# Altium schematic sheet 02.C216. A01-A31,A32,A33,A34,A35,A36. Module BASU executive mechanisms.SchDoc: Кабель исполнительных механизмов
size 209 x 297 mm; Author: Мурашкин Д.В.; Address1: Address1; Address2: Address2; Address3: Address3; Address4: Address4; DocumentNumber: ИЗДЕЛИЕ-1-2; SheetNumber: 27; Scale: 1:1; Letter1Column: Э
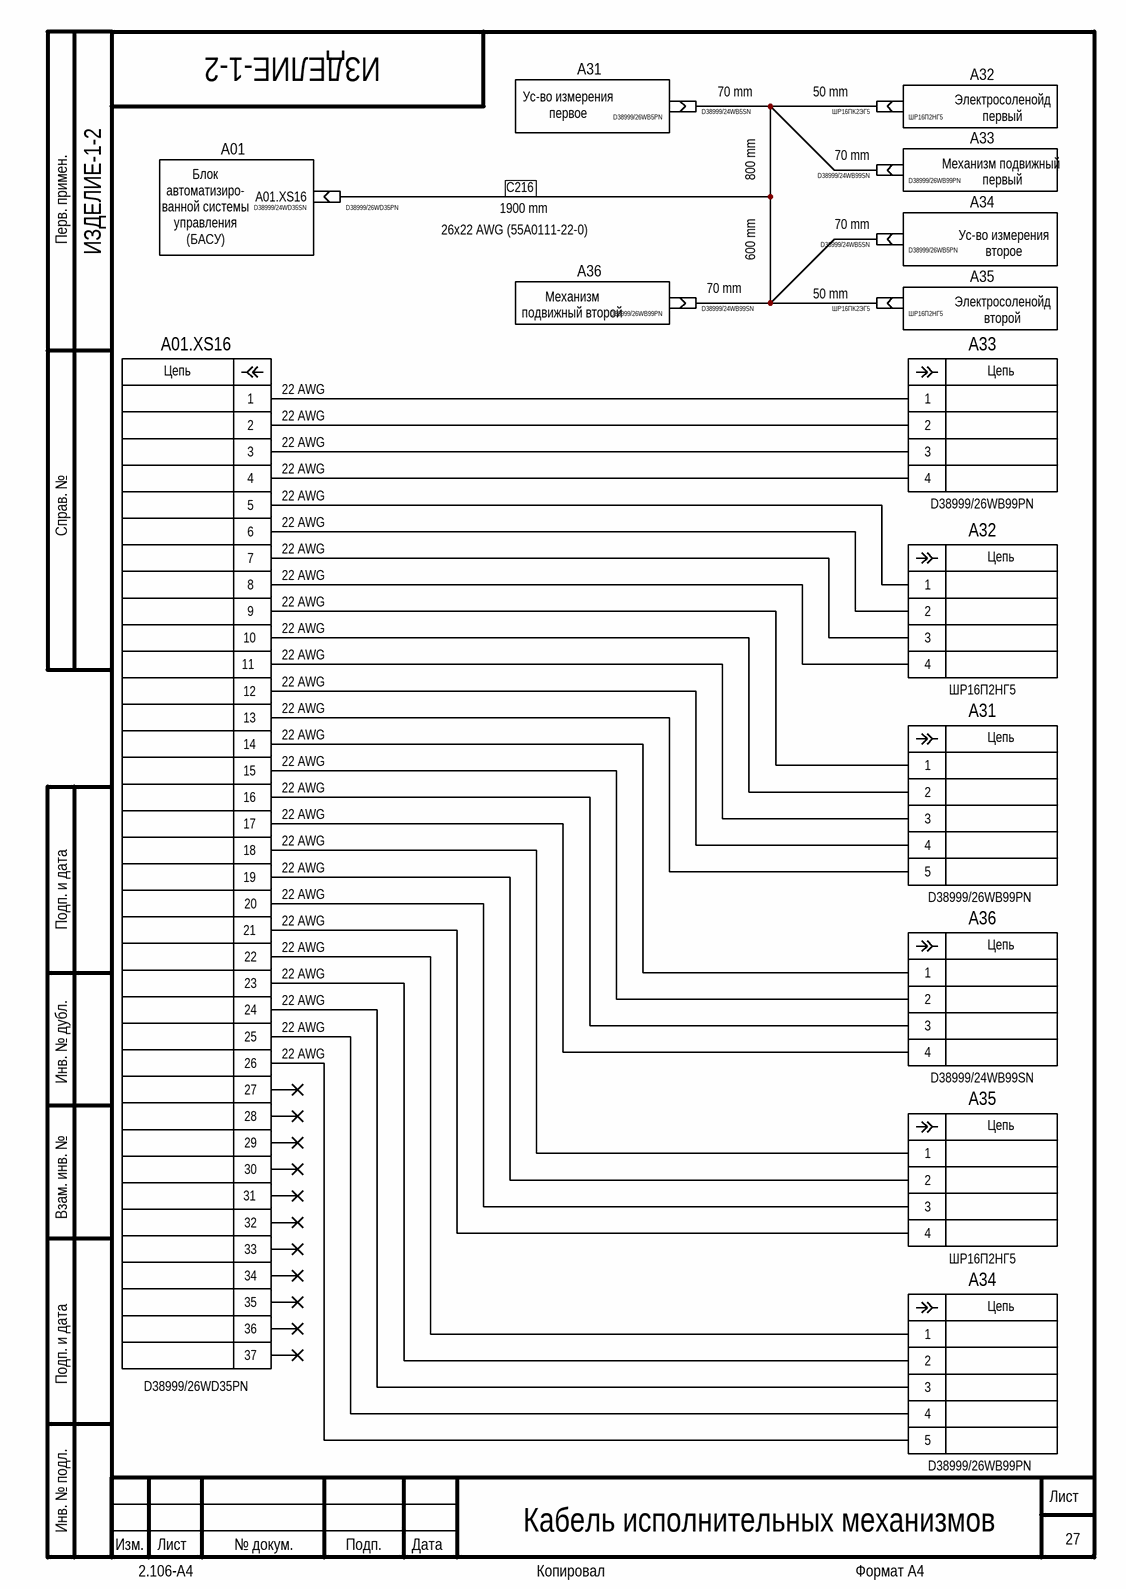
[diagram p0: 02.C216. A01-A31,A32,A33,A34,A35,A36. Module BASU executive mechanisms.SchDoc]

## Parts
(Parts that share a designator on the sheet are numbered #1, #2 ... from top to bottom, then left to right.)
A01.XS16#1  D38999/24WD35SN
A01.XS16#2  D38999/26WD35PN
A01.XS16#3  D38999/26WD35PN
A31  D38999/26WB99PN
A32  ШР16П2НГ5
A33  D38999/26WB99PN
A34  D38999/26WB99PN
A35  ШР16П2НГ5
A36  D38999/24WB99SN
A?#1  D38999/26WB5PN
A?#2  D38999/24WB5SN
A?#3  ШР16ПК2ЭГ5
A?#4  ШР16П2НГ5  (no BOM)
A?#5  D38999/24WB99SN
A?#6  D38999/26WB99PN
A?#7  D38999/24WB5SN
A?#8  D38999/26WB5PN
A?#9  D38999/26WB99PN
A?#10  D38999/24WB99SN
A?#11  ШР16ПК2ЭГ5
A?#12  ШР16П2НГ5  (no BOM)

## Blocks framed on the sheet
A32: A?#4
A33: A?#6
A34: A?#8
A35: A?#12

## Nets
С216: A01.XS16#2.0 A?#2.0 A?#3.0 A?#5.0 A?#7.0 A?#10.0 A?#11.0
NetA01.XS16#3_1: A01.XS16#3.1 A33.1
NetA01.XS16#3_2: A01.XS16#3.2 A33.2
NetA01.XS16#3_3: A01.XS16#3.3 A33.3
NetA01.XS16#3_4: A01.XS16#3.4 A33.4
NetA01.XS16#3_5: A01.XS16#3.5 A32.1
NetA01.XS16#3_6: A01.XS16#3.6 A32.2
NetA01.XS16#3_7: A01.XS16#3.7 A32.3
NetA01.XS16#3_8: A01.XS16#3.8 A32.4
NetA01.XS16#3_9: A01.XS16#3.9 A31.1
NetA01.XS16#3_10: A01.XS16#3.10 A31.2
NetA01.XS16#3_11: A01.XS16#3.11 A31.3
NetA01.XS16#3_12: A01.XS16#3.12 A31.4
NetA01.XS16#3_13: A01.XS16#3.13 A31.5
NetA01.XS16#3_14: A01.XS16#3.14 A36.1
NetA01.XS16#3_15: A01.XS16#3.15 A36.2
NetA01.XS16#3_16: A01.XS16#3.16 A36.3
NetA01.XS16#3_17: A01.XS16#3.17 A36.4
NetA01.XS16#3_18: A01.XS16#3.18 A35.1
NetA01.XS16#3_19: A01.XS16#3.19 A35.2
NetA01.XS16#3_20: A01.XS16#3.20 A35.3
NetA01.XS16#3_21: A01.XS16#3.21 A35.4
NetA01.XS16#3_22: A01.XS16#3.22 A34.1
NetA01.XS16#3_23: A01.XS16#3.23 A34.2
NetA01.XS16#3_24: A01.XS16#3.24 A34.3
NetA01.XS16#3_25: A01.XS16#3.25 A34.4
NetA01.XS16#3_26: A01.XS16#3.26 A34.5

Not connected (* = marked no-connect by the designer): A01.XS16#1 0; A01.XS16#3 27* 28* 29* 30* 31* 32* 33* 34* 35* 36* 37*; A?#1 0; A?#4 0; A?#6 0; A?#8 0; A?#9 0; A?#12 0

## Notes on the sheet
- (near A?#1) Ус-во измерения первое
- A31
- (near A?#2) 70 mm
- (near A?#3) 50 mm
- (near A?#4) Электросоленойд первый
- A01
- 800 mm
- (near A?#5) 70 mm
- (near A?#6) Механизм подвижный
  первый
- Блок автоматизиро- ванной системы управления (БАСУ)
- 26x22 AWG (55A0111-22-0)
- 1900 mm
- 600 mm
- (near A?#7) 70 mm
- (near A?#8) Ус-во измерения второе
- (near A?#9) Механизм подвижный второй
- A36
- (near A?#10) 70 mm
- (near A?#11) 50 mm
- (near A?#12) Электросоленойд второй
- (near A01.XS16#3) 22 AWG
- Перв. примен.
- Справ. №
- Подп. и дата
- Инв. № дубл.
- Взам. инв. №
- Инв. № подл.
- Изм.
- Лист
- № докум.
- Подп.
- Дата
- 2.106-A4
- Копировал
- Формат А4
- (in symbol Connector signal P5_1) Цепь
- (in symbol Connector signal P5_1_1_3) Цепь
- (in symbol Connector signal P37 MIL) Цепь

## Library data of the parts
A01.XS16#1 A?#2 A?#3 A?#5 A?#7 A?#10 A?#11 = Connector cable socket: Operating temperature: -°C +°C; Mounting type: Surface mount; Dimension: .0mm x .0mm; Height: .0mm
  A01.XS16#1: Part name: D38999/24WD35SN
  A?#2 A?#7: Part name: D38999/24WB5SN
  A?#3 A?#11: Part name: ШР16ПК2ЭГ5
  A?#5 A?#10: Part name: D38999/24WB99SN
A01.XS16#2 A?#1 A?#4 A?#6 A?#8 A?#9 A?#12 = Connector cable plug: Operating temperature: -°C +°C; Mounting type: Surface mount; Dimension: .0mm x .0mm; Height: .0mm
  A01.XS16#2: Part name: D38999/26WD35PN
  A?#1 A?#8: Part name: D38999/26WB5PN
  A?#4 A?#12: Part name: ШР16П2НГ5
  A?#6 A?#9: Part name: D38999/26WB99PN
A01.XS16#3 = Connector signal P37 MIL: P37 MIL; Operating temperature: -°C +°C; Mounting type: Surface mount; Dimension: .0mm x .0mm; Height: .0mm
A31 A34 = Connector signal P5_1: P5 MIL; Operating temperature: -°C +°C; Mounting type: Surface mount; Dimension: .0mm x .0mm; Height: .0mm
A32 A33 A35 A36 = Connector signal P5_1_1_3: P4 MIL_1; Operating temperature: -°C +°C; Mounting type: Surface mount; Dimension: .0mm x .0mm; Height: .0mm